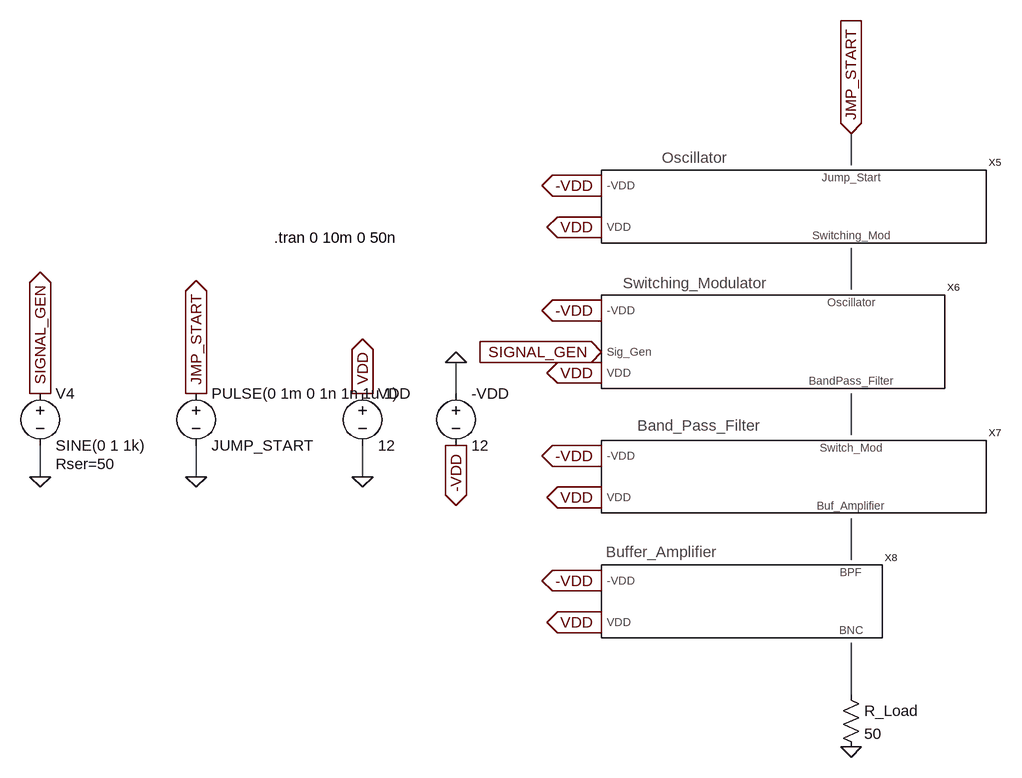
[diagram p0: schematic Top.asc]
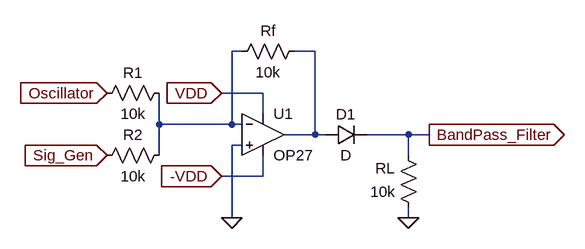
[diagram p1: sub-circuit switching_modulator.asc]
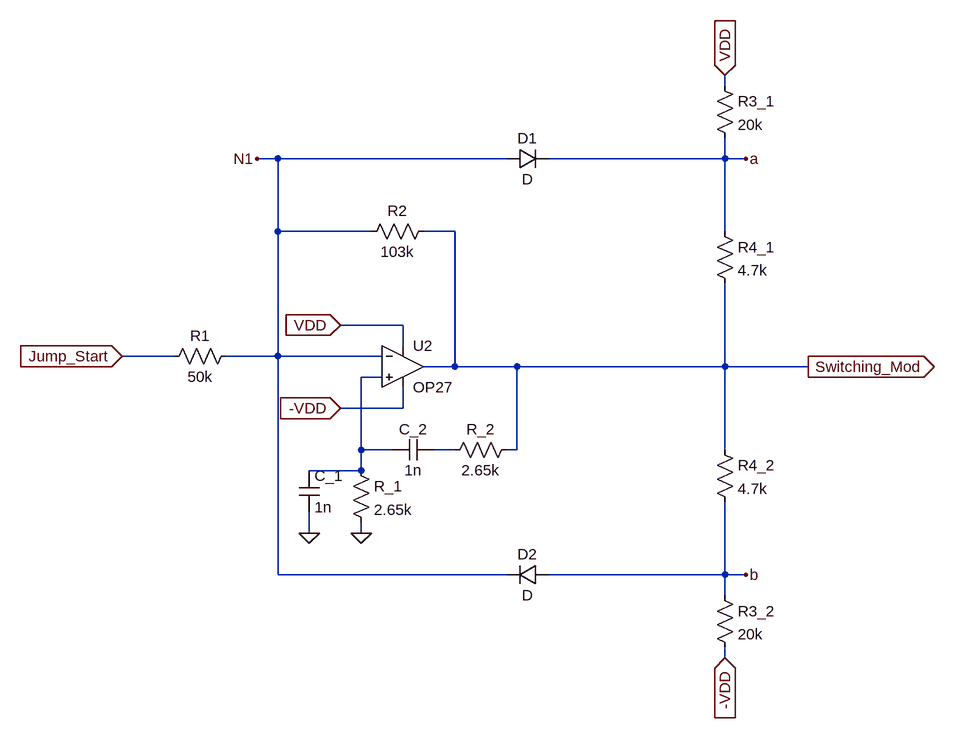
[diagram p2: sub-circuit oscillator.asc]
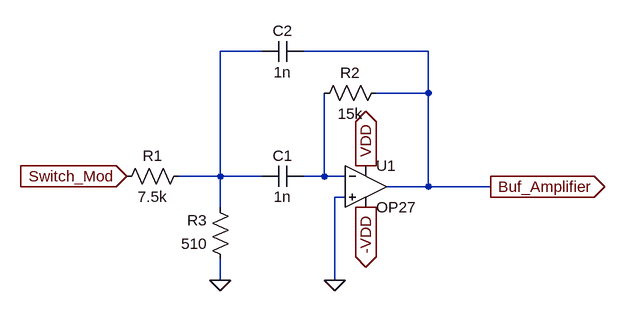
[diagram p3: sub-circuit band_pass_filter.asc]
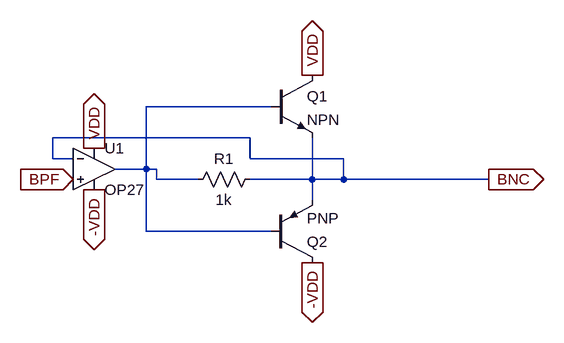
[diagram p4: sub-circuit buffer_amplifier.asc]
Top.asc, the LTspice schematic file:
Version 4.1
SHEET 1 2632 1100
WIRE 800 128 800 80
WIRE 800 320 800 256
WIRE 192 480 192 432
WIRE 800 544 800 480
WIRE -448 608 -448 560
WIRE -208 608 -208 560
WIRE 48 608 48 560
WIRE 800 736 800 672
WIRE 800 944 800 864
FLAG 48 480 VDD
IOPIN 48 480 Out
FLAG 48 608 0
FLAG 192 432 0
FLAG 192 560 -VDD
IOPIN 192 560 Out
FLAG -208 608 0
FLAG -208 480 JMP_START
IOPIN -208 480 Out
FLAG 800 80 JMP_START
IOPIN 800 80 In
FLAG -448 608 0
FLAG -448 480 SIGNAL_GEN
IOPIN -448 480 Out
FLAG 416 416 SIGNAL_GEN
IOPIN 416 416 In
FLAG 416 224 VDD
IOPIN 416 224 Out
FLAG 416 448 VDD
IOPIN 416 448 Out
FLAG 416 640 VDD
IOPIN 416 640 Out
FLAG 416 832 VDD
IOPIN 416 832 Out
FLAG 416 768 -VDD
IOPIN 416 768 Out
FLAG 416 576 -VDD
IOPIN 416 576 Out
FLAG 416 352 -VDD
IOPIN 416 352 Out
FLAG 416 160 -VDD
IOPIN 416 160 Out
FLAG 800 1024 0
SYMBOL voltage 48 464 R0
WINDOW 123 0 0 Left 0
WINDOW 39 0 0 Left 0
SYMATTR InstName VDD
SYMATTR Value 12
SYMBOL voltage 192 464 R0
WINDOW 123 0 0 Left 0
WINDOW 39 0 0 Left 0
SYMATTR InstName -VDD
SYMATTR Value 12
SYMBOL Switching_Modulator 672 400 R0
SYMATTR InstName X6
SYMBOL Oscillator 704 192 R0
SYMATTR InstName X5
SYMBOL Band_Pass_Filter 704 608 R0
SYMATTR InstName X7
SYMBOL Buffer_Amplifier 624 800 R0
SYMATTR InstName X8
SYMBOL voltage -208 464 R0
WINDOW 0 24 96 Left 2
WINDOW 3 24 16 Left 2
WINDOW 123 0 0 Left 0
WINDOW 39 0 0 Left 0
SYMATTR InstName JUMP_START
SYMATTR Value PULSE(0 1m 0 1n 1n 1u 1)
SYMBOL voltage -448 464 R0
WINDOW 123 0 0 Left 0
WINDOW 39 24 124 Left 2
SYMATTR SpiceLine Rser=50
SYMATTR InstName V4
SYMATTR Value SINE(0 1 1k)
SYMBOL res 784 928 R0
SYMATTR InstName R_Load
SYMATTR Value 50
TEXT -88 240 Left 2 !.tran 0 10m 0 50n

switching_modulator.asc, the sub-circuit schematic file:
Version 4.1
SHEET 1 880 680
WIRE -80 -352 -96 -352
WIRE 32 -352 0 -352
WIRE -48 -288 -112 -288
WIRE -48 -256 -48 -288
WIRE -208 -240 -208 -288
WIRE -96 -240 -96 -352
WIRE -96 -240 -208 -240
WIRE -80 -240 -96 -240
WIRE 32 -224 32 -352
WIRE 32 -224 -16 -224
WIRE 48 -224 32 -224
WIRE 176 -224 112 -224
WIRE 208 -224 176 -224
WIRE -80 -208 -96 -208
WIRE -208 -192 -208 -240
WIRE 176 -192 176 -224
WIRE -48 -160 -48 -192
WIRE -48 -160 -112 -160
WIRE -96 -96 -96 -208
WIRE 176 -96 176 -112
FLAG -96 -96 0
FLAG 176 -96 0
FLAG -112 -288 VDD
IOPIN -112 -288 In
FLAG -112 -160 -VDD
IOPIN -112 -160 In
FLAG 208 -224 BandPass_Filter
IOPIN 208 -224 Out
FLAG -288 -288 Oscillator
IOPIN -288 -288 In
FLAG -288 -192 Sig_Gen
IOPIN -288 -192 In
SYMBOL OpAmps\\OP27 -48 -288 R0
SYMATTR InstName U1
SYMBOL res 16 -368 R90
WINDOW 0 0 56 VBottom 2
WINDOW 3 32 56 VTop 2
SYMATTR InstName Rf
SYMATTR Value 10k
SYMBOL res 192 -96 R180
WINDOW 0 36 76 Left 2
WINDOW 3 36 40 Left 2
SYMATTR InstName RL
SYMATTR Value 10k
SYMBOL res -304 -176 R270
WINDOW 0 32 56 VTop 2
WINDOW 3 0 56 VBottom 2
SYMATTR InstName R2
SYMATTR Value 10k
SYMBOL res -304 -272 R270
WINDOW 0 32 56 VTop 2
WINDOW 3 0 56 VBottom 2
SYMATTR InstName R1
SYMATTR Value 10k
SYMBOL diode 48 -208 R270
WINDOW 0 32 32 VTop 2
WINDOW 3 0 32 VBottom 2
SYMATTR InstName D1

oscillator.asc, the sub-circuit schematic file:
Version 4.1
SHEET 1 1652 1700
WIRE -1840 560 -1840 544
WIRE -2528 672 -2560 672
WIRE -2176 672 -2528 672
WIRE -1840 672 -1840 640
WIRE -1840 672 -2112 672
WIRE -1808 672 -1840 672
WIRE -2528 784 -2528 672
WIRE -2384 784 -2528 784
WIRE -2256 784 -2304 784
WIRE -1840 784 -1840 672
WIRE -2336 928 -2432 928
WIRE -2336 960 -2336 928
WIRE -2688 976 -2768 976
WIRE -2528 976 -2528 784
WIRE -2528 976 -2608 976
WIRE -2368 976 -2528 976
WIRE -2256 992 -2256 784
WIRE -2256 992 -2304 992
WIRE -2160 992 -2256 992
WIRE -1840 992 -1840 864
WIRE -1840 992 -2160 992
WIRE -1712 992 -1840 992
WIRE -2368 1008 -2400 1008
WIRE -2336 1056 -2336 1024
WIRE -2336 1056 -2432 1056
WIRE -2400 1120 -2400 1008
WIRE -2352 1120 -2400 1120
WIRE -2256 1120 -2288 1120
WIRE -2160 1120 -2160 992
WIRE -2160 1120 -2176 1120
WIRE -1840 1120 -1840 992
WIRE -2400 1152 -2400 1120
WIRE -2400 1152 -2480 1152
WIRE -2480 1248 -2480 1216
WIRE -2400 1248 -2400 1232
WIRE -2528 1312 -2528 976
WIRE -2176 1312 -2528 1312
WIRE -1840 1312 -1840 1200
WIRE -1840 1312 -2112 1312
WIRE -1808 1312 -1840 1312
WIRE -1840 1344 -1840 1312
WIRE -1840 1440 -1840 1424
FLAG -1840 544 VDD
IOPIN -1840 544 In
FLAG -1840 1440 -VDD
IOPIN -1840 1440 In
FLAG -2432 928 VDD
IOPIN -2432 928 In
FLAG -2432 1056 -VDD
IOPIN -2432 1056 In
FLAG -2560 672 N1
FLAG -1808 672 a
FLAG -1808 1312 b
FLAG -1712 992 Switching_Mod
IOPIN -1712 992 Out
FLAG -2480 1248 0
FLAG -2400 1248 0
FLAG -2768 976 Jump_Start
IOPIN -2768 976 In
SYMBOL diode -2176 688 R270
WINDOW 0 32 32 VTop 2
WINDOW 3 0 32 VBottom 2
SYMATTR InstName D1
SYMBOL OpAmps\\OP27 -2336 928 R0
SYMATTR InstName U2
SYMBOL res -2288 768 R90
WINDOW 0 0 56 VBottom 2
WINDOW 3 32 56 VTop 2
SYMATTR InstName R2
SYMATTR Value 103k
SYMBOL res -2592 960 R90
WINDOW 0 0 56 VBottom 2
WINDOW 3 32 56 VTop 2
SYMATTR InstName R1
SYMATTR Value 50k
SYMBOL cap -2496 1152 R0
SYMATTR InstName C_1
SYMATTR Value 1n
SYMBOL res -2416 1136 R0
SYMATTR InstName R_1
SYMATTR Value 2.65k
SYMBOL cap -2288 1104 R90
WINDOW 0 0 32 VBottom 2
WINDOW 3 32 32 VTop 2
SYMATTR InstName C_2
SYMATTR Value 1n
SYMBOL res -2160 1104 R90
WINDOW 0 0 56 VBottom 2
WINDOW 3 32 56 VTop 2
SYMATTR InstName R_2
SYMATTR Value 2.65k
SYMBOL diode -2112 1296 R90
WINDOW 0 0 32 VBottom 2
WINDOW 3 32 32 VTop 2
SYMATTR InstName D2
SYMBOL res -1856 544 R0
SYMATTR InstName R3_1
SYMATTR Value 20k
SYMBOL res -1856 768 R0
SYMATTR InstName R4_1
SYMATTR Value 4.7k
SYMBOL res -1856 1104 R0
SYMATTR InstName R4_2
SYMATTR Value 4.7k
SYMBOL res -1856 1328 R0
SYMATTR InstName R3_2
SYMATTR Value 20k

band_pass_filter.asc, the sub-circuit schematic file:
Version 4.1
SHEET 1 2756 680
WIRE 48 -480 -16 -480
WIRE 304 -480 112 -480
WIRE 304 -416 304 -480
WIRE 304 -416 224 -416
WIRE -16 -288 -16 -480
WIRE -16 -288 -80 -288
WIRE 48 -288 -16 -288
WIRE 144 -288 144 -416
WIRE 144 -288 112 -288
WIRE 176 -288 144 -288
WIRE 304 -272 304 -416
WIRE 304 -272 240 -272
WIRE 400 -272 304 -272
WIRE 176 -256 160 -256
WIRE -16 -240 -16 -288
WIRE -16 -128 -16 -160
WIRE 160 -128 160 -256
FLAG -16 -128 0
FLAG 160 -128 0
FLAG 400 -272 Buf_Amplifier
IOPIN 400 -272 Out
FLAG 208 -304 VDD
IOPIN 208 -304 Out
FLAG 208 -240 -VDD
IOPIN 208 -240 Out
FLAG -160 -288 Switch_Mod
IOPIN -160 -288 In
SYMBOL OpAmps\\OP27 208 -336 R0
SYMATTR InstName U1
SYMBOL cap 112 -304 R90
WINDOW 0 0 32 VBottom 2
WINDOW 3 32 32 VTop 2
SYMATTR InstName C1
SYMATTR Value 1n
SYMBOL cap 112 -496 R90
WINDOW 0 0 32 VBottom 2
WINDOW 3 32 32 VTop 2
SYMATTR InstName C2
SYMATTR Value 1n
SYMBOL res -64 -304 R90
WINDOW 0 0 56 VBottom 2
WINDOW 3 32 56 VTop 2
SYMATTR InstName R1
SYMATTR Value 7.5k
SYMBOL res 240 -432 R90
WINDOW 0 0 56 VBottom 2
WINDOW 3 32 56 VTop 2
SYMATTR InstName R2
SYMATTR Value 15k
SYMBOL res 0 -144 R180
WINDOW 0 36 76 Left 2
WINDOW 3 36 40 Left 2
SYMATTR InstName R3
SYMATTR Value 510

buffer_amplifier.asc, the sub-circuit schematic file:
Version 4.1
SHEET 1 892 680
WIRE -576 -576 -768 -576
WIRE -608 -528 -912 -528
WIRE -912 -496 -912 -528
WIRE -880 -496 -912 -496
WIRE -608 -496 -608 -528
WIRE -464 -496 -608 -496
WIRE -768 -480 -768 -576
WIRE -768 -480 -816 -480
WIRE -752 -480 -768 -480
WIRE -752 -464 -752 -480
WIRE -688 -464 -752 -464
WIRE -512 -464 -512 -528
WIRE -512 -464 -608 -464
WIRE -464 -464 -464 -496
WIRE -464 -464 -512 -464
WIRE -240 -464 -464 -464
WIRE -512 -432 -512 -464
WIRE -768 -384 -768 -480
WIRE -576 -384 -768 -384
FLAG -848 -512 VDD
IOPIN -848 -512 Out
FLAG -848 -448 -VDD
IOPIN -848 -448 Out
FLAG -512 -336 -VDD
IOPIN -512 -336 Out
FLAG -512 -624 VDD
IOPIN -512 -624 Out
FLAG -880 -464 BPF
IOPIN -880 -464 In
FLAG -240 -464 BNC
IOPIN -240 -464 Out
SYMBOL npn -576 -624 R0
SYMATTR InstName Q1
SYMBOL pnp -576 -336 M180
SYMATTR InstName Q2
SYMBOL OpAmps\\OP27 -848 -544 R0
SYMATTR InstName U1
SYMBOL res -592 -480 R90
WINDOW 0 0 56 VBottom 2
WINDOW 3 32 56 VTop 2
SYMATTR InstName R1
SYMATTR Value 1k

The netlist it stands for:
* Top.asc
VDD VDD 0 12
V§-VDD 0 -VDD 12
X§X6 -VDD N001 SIGNAL_GEN VDD N002 switching_modulator
X§X5 -VDD JMP_START VDD N001 oscillator
X§X7 N002 -VDD N003 VDD band_pass_filter
X§X8 N003 -VDD N004 VDD buffer_amplifier
V§JUMP_START JMP_START 0 PULSE(0 1m 0 1n 1n 1u 1)
V4 SIGNAL_GEN 0 SINE(0 1 1k) Rser=50
R_Load N004 0 50

* block symbol definitions
.subckt switching_modulator -VDD Oscillator Sig_Gen VDD BandPass_Filter
X§U1 0 N001 VDD -VDD N002 OP27  ; pins In+ In- V+ V- OUT
Rf N002 N001 10k
RL 0 BandPass_Filter 10k
R2 Sig_Gen N001 10k
R1 Oscillator N001 10k
D1 N002 BandPass_Filter D
.ends switching_modulator

.subckt oscillator -VDD Jump_Start VDD Switching_Mod
D1 N1 a D
X§U2 N001 N1 VDD -VDD Switching_Mod OP27  ; pins In+ In- V+ V- OUT
R2 Switching_Mod N1 103k
R1 N1 Jump_Start 50k
C_1 N001 0 1n
R_1 N001 0 2.65k
C_2 N002 N001 1n
R_2 Switching_Mod N002 2.65k
D2 b N1 D
R3_1 VDD a 20k
R4_1 a Switching_Mod 4.7k
R4_2 Switching_Mod b 4.7k
R3_2 b -VDD 20k
.ends oscillator

.subckt band_pass_filter Switch_Mod -VDD Buf_Amplifier VDD
X§U1 0 N002 VDD -VDD Buf_Amplifier OP27  ; pins In+ In- V+ V- OUT
C1 N002 N001 1n
C2 Buf_Amplifier N001 1n
R1 N001 Switch_Mod 7.5k
R2 Buf_Amplifier N002 15k
R3 0 N001 510
.ends band_pass_filter

.subckt buffer_amplifier BPF -VDD BNC VDD
Q1 VDD N001 BNC 0 NPN
Q2 -VDD N001 BNC 0 PNP
X§U1 BPF BNC VDD -VDD N001 OP27  ; pins In+ In- V+ V- OUT
R1 BNC N001 1k
.ends buffer_amplifier

.model D D
.lib standard.dio
.model NPN NPN
.model PNP PNP
.lib standard.bjt
.tran 0 10m 0 50n
.lib ADI.lib
.backanno
.end